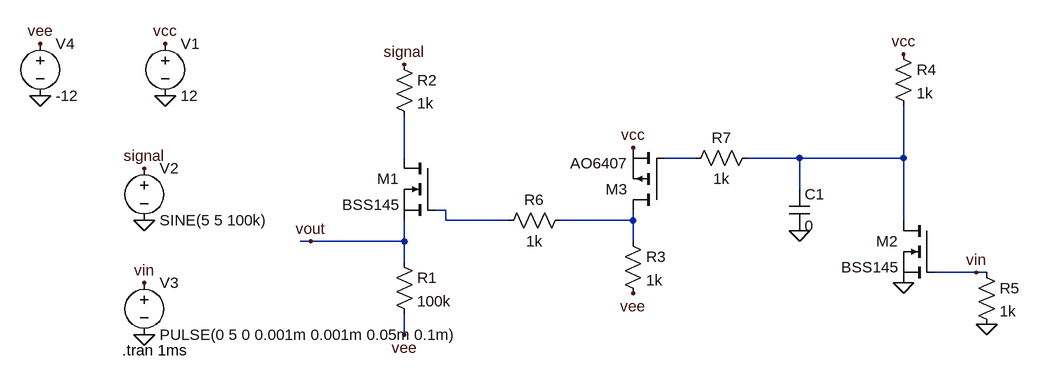
[diagram p0: schematic dc_load_turnon_signal.asc]
dc_load_turnon_signal.asc, the LTspice schematic file:
Version 4
SHEET 1 1048 680
WIRE 96 32 96 -32
WIRE 544 32 496 32
WIRE 704 32 624 32
WIRE 864 32 864 -48
WIRE 864 32 704 32
WIRE 704 80 704 32
WIRE 160 112 144 112
WIRE 160 128 160 112
WIRE 256 128 160 128
WIRE 448 128 448 112
WIRE 448 128 336 128
WIRE 864 128 864 32
WIRE -48 160 -64 160
WIRE 96 160 96 128
WIRE 96 160 -48 160
WIRE 448 160 448 128
WIRE 96 192 96 160
WIRE 976 208 912 208
WIRE 992 208 976 208
WIRE 96 304 96 272
FLAG -272 -64 0
FLAG -272 -144 vcc
FLAG -48 160 vout
FLAG 96 -112 signal
FLAG 864 -128 vcc
FLAG 864 224 0
FLAG -304 128 0
FLAG -304 48 signal
FLAG -304 304 0
FLAG -304 224 vin
FLAG -464 -64 0
FLAG -464 -144 vee
FLAG 96 304 vee
FLAG 448 16 vcc
FLAG 448 240 vee
FLAG 992 288 0
FLAG 704 144 0
FLAG 976 208 vin
SYMBOL res 80 176 R0
SYMATTR InstName R1
SYMATTR Value 100k
SYMBOL res 80 -128 R0
SYMATTR InstName R2
SYMATTR Value 1k
SYMBOL nmos 144 32 M0
SYMATTR InstName M1
SYMATTR Value BSS145
SYMBOL nmos 912 128 M0
SYMATTR InstName M2
SYMATTR Value BSS145
SYMBOL voltage -272 -160 R0
WINDOW 123 0 0 Left 2
WINDOW 39 0 0 Left 2
SYMATTR InstName V1
SYMATTR Value 12
SYMBOL res 848 -144 R0
SYMATTR InstName R4
SYMATTR Value 1k
SYMBOL voltage -304 32 R0
WINDOW 123 0 0 Left 2
WINDOW 39 0 0 Left 2
SYMATTR InstName V2
SYMATTR Value SINE(5 5 100k)
SYMBOL voltage -304 208 R0
WINDOW 123 0 0 Left 2
WINDOW 39 0 0 Left 2
SYMATTR InstName V3
SYMATTR Value PULSE(0 5 0 0.001m 0.001m 0.05m 0.1m)
SYMBOL voltage -464 -160 R0
WINDOW 123 0 0 Left 2
WINDOW 39 0 0 Left 2
SYMATTR InstName V4
SYMATTR Value -12
SYMBOL pmos 496 112 R180
SYMATTR InstName M3
SYMATTR Value AO6407
SYMBOL res 432 144 R0
SYMATTR InstName R3
SYMATTR Value 1k
SYMBOL res 976 192 R0
SYMATTR InstName R5
SYMATTR Value 1k
SYMBOL cap 688 80 R0
SYMATTR InstName C1
SYMATTR Value 0
SYMBOL res 352 112 R90
WINDOW 0 0 56 VBottom 2
WINDOW 3 32 56 VTop 2
SYMATTR InstName R6
SYMATTR Value 1k
SYMBOL res 640 16 R90
WINDOW 0 0 56 VBottom 2
WINDOW 3 32 56 VTop 2
SYMATTR InstName R7
SYMATTR Value 1k
TEXT -338 328 Left 2 !.tran 1ms

The netlist it stands for:
* dc_load_turnon_signal.asc
R1 vout vee 100k
R2 signal N001 1k
M1 N001 N004 vout vout BSS145
M2 N003 vin 0 0 BSS145
V1 vcc 0 12
R4 vcc N003 1k
V2 signal 0 SINE(5 5 100k)
V3 vin 0 PULSE(0 5 0 0.001m 0.001m 0.05m 0.1m)
V4 vee 0 -12
M3 N005 N002 vcc vcc AO6407
R3 N005 vee 1k
R5 vin 0 1k
C1 N003 0 0
R6 N005 N004 1k
R7 N003 N002 1k
.model NMOS NMOS
.model PMOS PMOS
.lib standard.mos
.tran 1ms
.backanno
.end